# Altium schematic sheet S1_Connectors.SchDoc
size 420 x 297 mm; Title2: hello; Project: myfc_base; ENG_APP_DATE: --/--/--; DSN_APP_DATE: --/--/--; CHK_APP_DATE: --/--/--; SheetNumber: 1; SheetTotal: 8
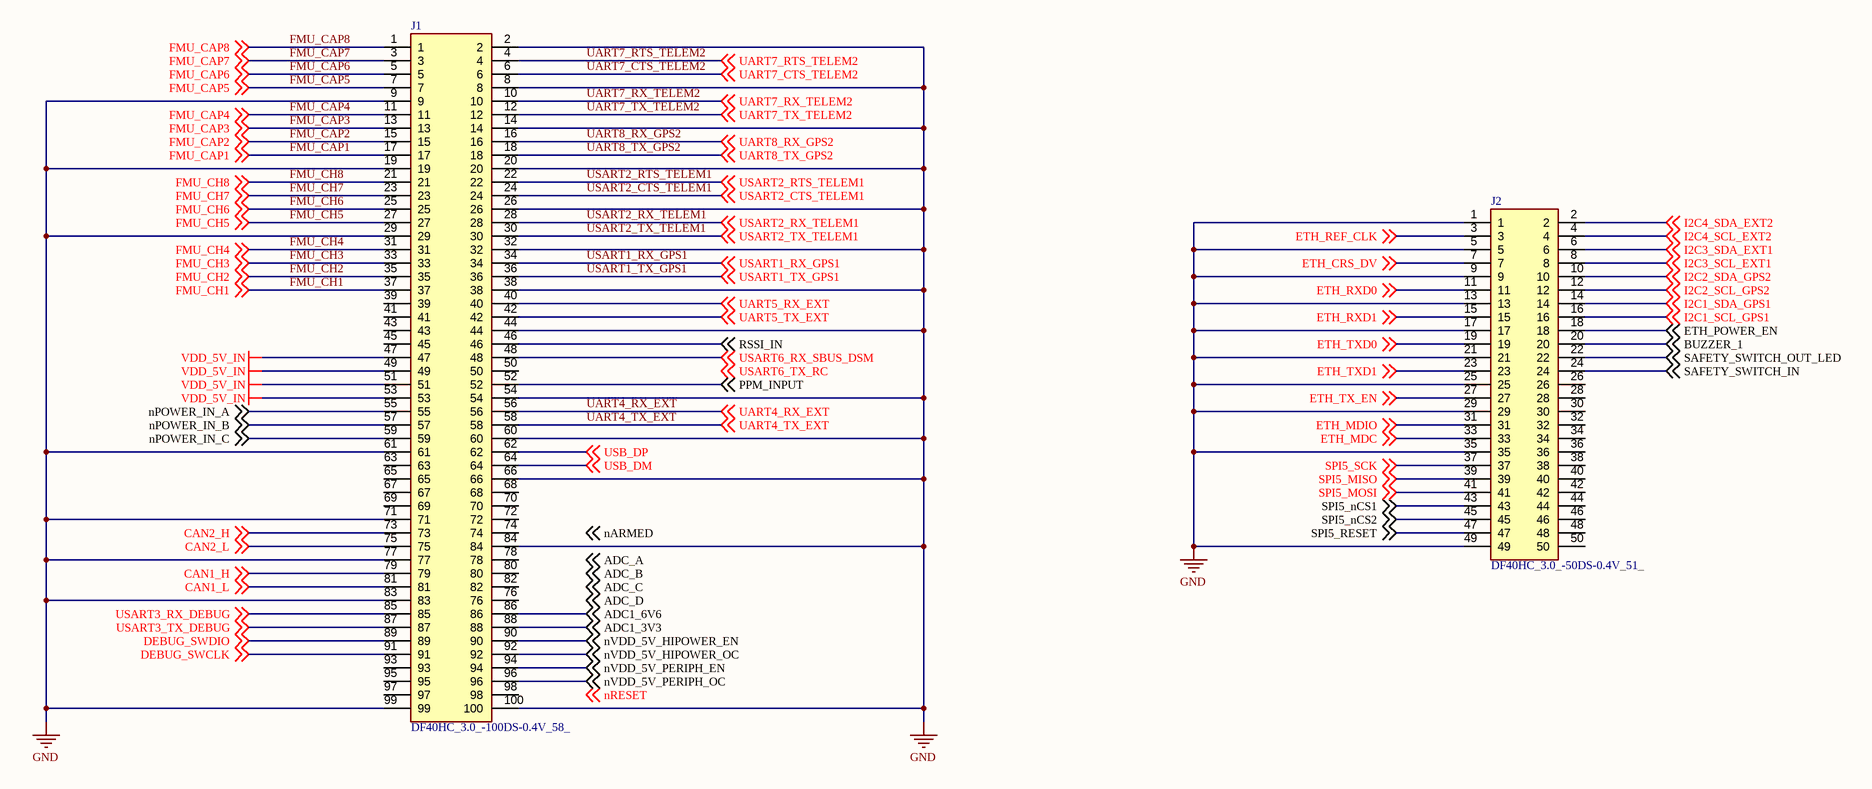
[diagram p0: S1_Connectors.SchDoc]

## Parts
J1  DF40HC_3.0_-100DS-0.4V_58_  [DF40HC30100DS04V58]
J2  DF40HC_3.0_-50DS-0.4V_51_  [DF40HC3050DS04V51]

## Nets
GND: J1.2 J1.8 J1.9 J1.14 J1.19 J1.20 J1.26 J1.29 J1.32 J1.38 J1.44 J1.54 J1.60 J1.61 J1.66 J1.71 J1.77 J1.83 J1.84 J1.99 J1.100 J2.1 J2.5 J2.9 J2.13 J2.17 J2.21 J2.25 J2.29 J2.35 J2.49
VDD_5V_IN: J1.47 J1.49 J1.51 J1.53
ADC1_3V3: J1.88 ; off-sheet ADC1_3V3
ADC1_6V6: J1.86 ; off-sheet ADC1_6V6
BUZZER_1: J2.20 ; off-sheet BUZZER_1
CAN1_H: J1.79 ; off-sheet CAN1_H
CAN1_L: J1.81 ; off-sheet CAN1_L
CAN2_H: J1.73 ; off-sheet CAN2_H
CAN2_L: J1.75 ; off-sheet CAN2_L
DEBUG_SWCLK: J1.91 ; off-sheet DEBUG_SWCLK
DEBUG_SWDIO: J1.89 ; off-sheet DEBUG_SWDIO
ETH_CRS_DV: J2.7 ; off-sheet ETH_CRS_DV
ETH_MDC: J2.33 ; off-sheet ETH_MDC
ETH_MDIO: J2.31 ; off-sheet ETH_MDIO
ETH_POWER_EN: J2.18 ; off-sheet ETH_POWER_EN
ETH_REF_CLK: J2.3 ; off-sheet ETH_REF_CLK
ETH_RXD0: J2.11 ; off-sheet ETH_RXD0
ETH_RXD1: J2.15 ; off-sheet ETH_RXD1
ETH_TX_EN: J2.27 ; off-sheet ETH_TX_EN
ETH_TXD0: J2.19 ; off-sheet ETH_TXD0
ETH_TXD1: J2.23 ; off-sheet ETH_TXD1
FMU_CAP1: J1.17 ; off-sheet FMU_CAP1
FMU_CAP2: J1.15 ; off-sheet FMU_CAP2
FMU_CAP3: J1.13 ; off-sheet FMU_CAP3
FMU_CAP4: J1.11 ; off-sheet FMU_CAP4
FMU_CAP5: J1.7 ; off-sheet FMU_CAP5
FMU_CAP6: J1.5 ; off-sheet FMU_CAP6
FMU_CAP7: J1.3 ; off-sheet FMU_CAP7
FMU_CAP8: J1.1 ; off-sheet FMU_CAP8
FMU_CH1: J1.37 ; off-sheet FMU_CH1
FMU_CH2: J1.35 ; off-sheet FMU_CH2
FMU_CH3: J1.33 ; off-sheet FMU_CH3
FMU_CH4: J1.31 ; off-sheet FMU_CH4
FMU_CH5: J1.27 ; off-sheet FMU_CH5
FMU_CH6: J1.25 ; off-sheet FMU_CH6
FMU_CH7: J1.23 ; off-sheet FMU_CH7
FMU_CH8: J1.21 ; off-sheet FMU_CH8
I2C1_SCL_GPS1: J2.16 ; off-sheet I2C1_SCL_GPS1
I2C1_SDA_GPS1: J2.14 ; off-sheet I2C1_SDA_GPS1
I2C2_SCL_GPS2: J2.12 ; off-sheet I2C2_SCL_GPS2
I2C2_SDA_GPS2: J2.10 ; off-sheet I2C2_SDA_GPS2
I2C3_SCL_EXT1: J2.8 ; off-sheet I2C3_SCL_EXT1
I2C3_SDA_EXT1: J2.6 ; off-sheet I2C3_SDA_EXT1
I2C4_SCL_EXT2: J2.4 ; off-sheet I2C4_SCL_EXT2
I2C4_SDA_EXT2: J2.2 ; off-sheet I2C4_SDA_EXT2
nPOWER_IN_A: J1.55 ; off-sheet nPOWER_IN_A
nPOWER_IN_B: J1.57 ; off-sheet nPOWER_IN_B
nPOWER_IN_C: J1.59 ; off-sheet nPOWER_IN_C
nVDD_5V_HIPOWER_EN: J1.90 ; off-sheet nVDD_5V_HIPOWER_EN
nVDD_5V_HIPOWER_OC: J1.92 ; off-sheet nVDD_5V_HIPOWER_OC
nVDD_5V_PERIPH_EN: J1.94 ; off-sheet nVDD_5V_PERIPH_EN
nVDD_5V_PERIPH_OC: J1.96 ; off-sheet nVDD_5V_PERIPH_OC
PPM_INPUT: J1.52 ; off-sheet PPM_INPUT
RSSI_IN: J1.46 ; off-sheet RSSI_IN
SAFETY_SWITCH_IN: J2.24 ; off-sheet SAFETY_SWITCH_IN
SAFETY_SWITCH_OUT_LED: J2.22 ; off-sheet SAFETY_SWITCH_OUT_LED
SPI5_MISO: J2.39 ; off-sheet SPI5_MISO
SPI5_MOSI: J2.41 ; off-sheet SPI5_MOSI
SPI5_nCS1: J2.43 ; off-sheet SPI5_nCS1
SPI5_nCS2: J2.45 ; off-sheet SPI5_nCS2
SPI5_RESET: J2.47 ; off-sheet SPI5_RESET
SPI5_SCK: J2.37 ; off-sheet SPI5_SCK
UART4_RX_EXT: J1.56 ; off-sheet UART4_RX_EXT
UART4_TX_EXT: J1.58 ; off-sheet UART4_TX_EXT
UART5_RX_EXT: J1.40 ; off-sheet UART5_RX_EXT
UART5_TX_EXT: J1.42 ; off-sheet UART5_TX_EXT
UART7_CTS_TELEM2: J1.6 ; off-sheet UART7_CTS_TELEM2
UART7_RTS_TELEM2: J1.4 ; off-sheet UART7_RTS_TELEM2
UART7_RX_TELEM2: J1.10 ; off-sheet UART7_RX_TELEM2
UART7_TX_TELEM2: J1.12 ; off-sheet UART7_TX_TELEM2
UART8_RX_GPS2: J1.16 ; off-sheet UART8_RX_GPS2
UART8_TX_GPS2: J1.18 ; off-sheet UART8_TX_GPS2
USART1_RX_GPS1: J1.34 ; off-sheet USART1_RX_GPS1
USART1_TX_GPS1: J1.36 ; off-sheet USART1_TX_GPS1
USART2_CTS_TELEM1: J1.24 ; off-sheet USART2_CTS_TELEM1
USART2_RTS_TELEM1: J1.22 ; off-sheet USART2_RTS_TELEM1
USART2_RX_TELEM1: J1.28 ; off-sheet USART2_RX_TELEM1
USART2_TX_TELEM1: J1.30 ; off-sheet USART2_TX_TELEM1
USART3_RX_DEBUG: J1.85 ; off-sheet USART3_RX_DEBUG
USART3_TX_DEBUG: J1.87 ; off-sheet USART3_TX_DEBUG
USART6_RX_SBUS_DSM: J1.48 ; off-sheet USART6_RX_SBUS_DSM
USB_DM: J1.64 ; off-sheet USB_DM
USB_DP: J1.62 ; off-sheet USB_DP

Not connected (* = marked no-connect by the designer): J1 39 41 43 45 50 63 65 67 68 69 70 72 74 76 78 80 82 93 95 97 98; J2 26 28 30 32 34 36 38 40 42 44 46 48 50

## Notes on the sheet
- Labels drawn without touching a wire or pin: ADC_A, ADC_B, ADC_C, ADC_D, nARMED, nRESET, USART6_TX_RC
- THIS DOCUMENT AND THE DATA DISCLOSED HEREIN OR
- HEREWITH IS THE PROPERTY OF ALTIUM LIMITED AND MAY
- DWG NO:
- REVISION
- REV:
- DESCRIPTION
- DATE
- APPROVED
- BE FREELY DISTRIBUTED IN WHOLE. NO RIGHTS ARE
- RESERVED OR EXPRESS OR IMPLIED WARANTEE GIVEN.
- ENG:
- APPROVALS
- PROJECT
- DSN:
- CHK:
- REFERENCE DOCUMENTS
- PROJECT REVISION:
- TITLE
- DOCUMENT REVISION:
- DESIGN ITEM:
- BOM:
- FAB DWG:
- PCB DWG:
- ASSY DWG:
- SCALE:
- A3
- SIZE
- CAGE CODE
- FILE NAME
- DWG NO.
- SHEET
- OF
- REV

## Library data of the parts
J1 = CMP-002-00075-1: Hirose DF40 Series 0.4mm Pitch 100 Way 2 Row Straight PCB Socket, Surface Mount, Solder Termination; Manufacturer_Part_Number: DF40HC(3.0)-100DS-0.4V(58); Geometry.Height: 3.05mm; Datasheet Link: https://www.hirose.com/product/document?clcode=CL0684-4003-3-51&productname=DF40C-60DP-0.4V(51)&series=DF40&documenttype=Catalog&lang=en&documentid=D31649_en; Mouser Price/Stock: *; Source: DF40HC_3.0_-100DS-0.4V_58_.SchLib; Mouser Part Number: *; Design Item ID: DF40HC_3.0_-100DS-0.4V_58_; Manufacturer_Name: Hirose
J2 = CMP-002-00077-1: Board to Board & Mezzanine Connectors 50P RECPT 3.0 STK HT W/O METAL FITTING; Manufacturer_Name: Hirose; Manufacturer_Part_Number: DF40HC(3.0)-50DS-0.4V(51); Geometry.Height: 3.05mm; Design Item ID: DF40HC_3.0_-50DS-0.4V_51_; Datasheet Link: https://www.arrow.com/en/products/df40hc-3.0-50ds-0.4v-51/hirose-electric?region=nac; Mouser Part Number: 798-DF40HC3050DS04V; Mouser Price/Stock: https://www.mouser.co.uk/ProductDetail/Hirose-Connector/DF40HC3.0-50DS-0.4V51?qs=3aug5cyrIbckh%2FQLfpkocw%3D%3D; Source: DF40HC_3.0_-50DS-0.4V_51_.SchLib